# Altium schematic sheet ADC.SchDoc
size A4; SheetNumber: 9; SheetTotal: 12
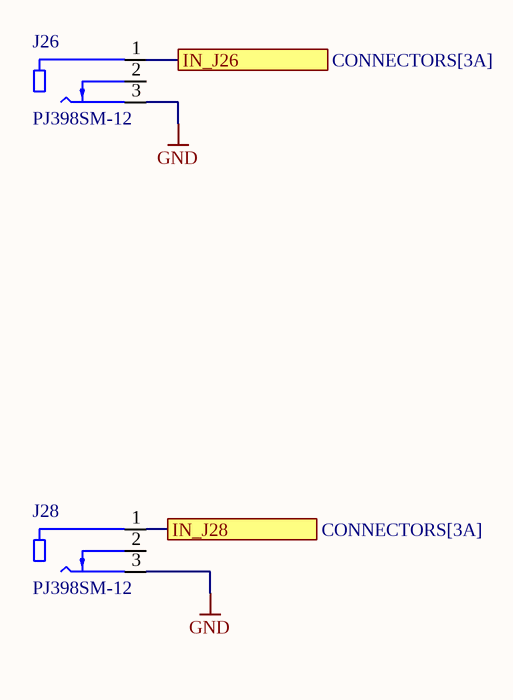
[diagram p0: ADC.SchDoc]

## Parts
J26  PJ398SM-12  [THONK_PJ398SM-12]
J28  PJ398SM-12  [THONK_PJ398SM-12]

## Ports
IN_J26 (see CONNECTORS[3A]), IN_J28 (see CONNECTORS[3A])

## Nets
GND: J26.3 J28.3
IN_J26: J26.1 ; port IN_J26
IN_J28: J28.1 ; port IN_J28

Not connected (* = marked no-connect by the designer): J26 2; J28 2

## Library data of the parts
J26 J28 = PJ398SM-12: 3.5mm Switching Jack Socket; MF: Thonk; Availability: Not in stock; Price: None; Package: Package; MP: PJ398SM-12; Value: *